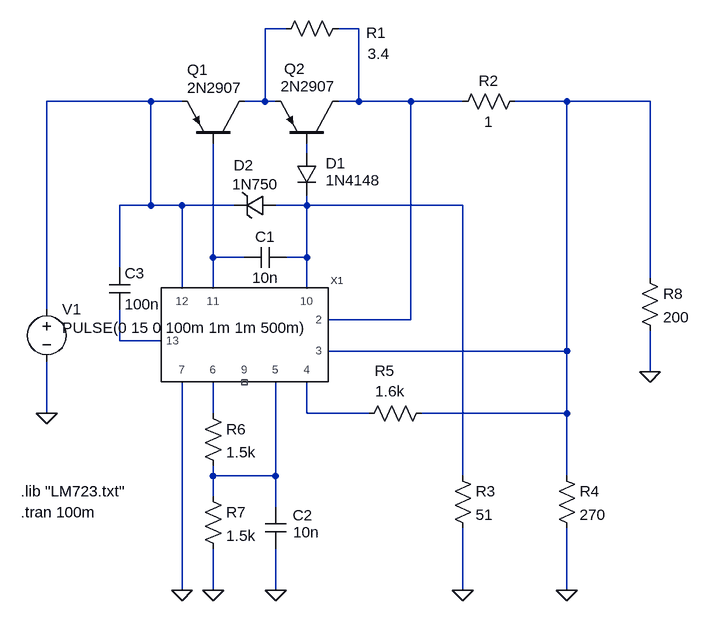
[diagram p0: schematic Draft4.asc]
Draft4.asc, the LTspice schematic file:
Version 4
SHEET 1 880 680
WIRE 176 -336 144 -336
WIRE 288 -336 256 -336
WIRE -32 -224 -192 -224
WIRE 16 -224 -32 -224
WIRE 144 -224 144 -336
WIRE 144 -224 112 -224
WIRE 160 -224 144 -224
WIRE 288 -224 288 -336
WIRE 288 -224 256 -224
WIRE 368 -224 288 -224
WIRE 448 -224 368 -224
WIRE 608 -224 528 -224
WIRE 736 -224 608 -224
WIRE 208 -144 208 -160
WIRE -32 -64 -32 -224
WIRE -32 -64 -80 -64
WIRE 16 -64 -32 -64
WIRE 96 -64 16 -64
WIRE 208 -64 208 -80
WIRE 208 -64 160 -64
WIRE 448 -64 208 -64
WIRE 64 16 64 -160
WIRE 112 16 64 16
WIRE 208 16 208 -64
WIRE 208 16 176 16
WIRE -80 32 -80 -64
WIRE 736 48 736 -224
WIRE 16 64 16 -64
WIRE 64 64 64 16
WIRE 208 64 208 16
WIRE -192 96 -192 -224
WIRE 368 112 368 -224
WIRE 368 112 240 112
WIRE -80 144 -80 96
WIRE -16 144 -80 144
WIRE 608 160 608 -224
WIRE 608 160 240 160
WIRE 736 192 736 128
WIRE -192 256 -192 176
WIRE 64 256 64 208
WIRE 208 256 208 208
WIRE 304 256 208 256
WIRE 608 256 608 160
WIRE 608 256 384 256
WIRE 64 352 64 336
WIRE 160 352 160 208
WIRE 160 352 64 352
WIRE 448 352 448 -64
WIRE 608 352 608 256
WIRE 64 384 64 352
WIRE 160 400 160 352
WIRE 16 528 16 208
WIRE 64 528 64 464
WIRE 160 528 160 464
WIRE 448 528 448 432
WIRE 608 528 608 432
FLAG -192 256 0
FLAG 736 192 0
FLAG 448 528 0
FLAG 608 528 0
FLAG 16 528 0
FLAG 64 528 0
FLAG 160 528 0
SYMBOL LM723 112 144 R0
SYMATTR InstName X1
SYMATTR Prefix X
SYMATTR SpiceModel LM723
SYMBOL voltage -192 80 R0
WINDOW 123 0 0 Left 2
WINDOW 39 0 0 Left 2
WINDOW 3 24 44 Left 2
SYMATTR InstName V1
SYMATTR Value PULSE(0 15 0 100m 1m 1m 500m)
SYMBOL pnp 112 -160 M270
WINDOW 0 113 88 VLeft 2
WINDOW 3 85 88 VLeft 2
SYMATTR InstName Q1
SYMATTR Value 2N2907
SYMBOL pnp 256 -160 M270
WINDOW 0 114 83 VLeft 2
WINDOW 3 87 88 VLeft 2
SYMATTR InstName Q2
SYMATTR Value 2N2907
SYMBOL diode 192 -144 R0
WINDOW 0 45 15 Left 2
WINDOW 3 45 41 Left 2
SYMATTR InstName D1
SYMATTR Value 1N4148
SYMBOL res 272 -352 R90
WINDOW 0 38 -43 VBottom 2
WINDOW 3 39 -47 VTop 2
SYMATTR InstName R1
SYMATTR Value 3.4
SYMBOL cap 176 0 R90
WINDOW 0 0 32 VBottom 2
WINDOW 3 32 32 VTop 2
SYMATTR InstName C1
SYMATTR Value 10n
SYMBOL res 544 -240 R90
WINDOW 0 0 56 VBottom 2
WINDOW 3 32 56 VTop 2
SYMATTR InstName R2
SYMATTR Value 1
SYMBOL zener 160 -80 R90
WINDOW 0 -30 49 VBottom 2
WINDOW 3 -32 31 VTop 2
SYMATTR InstName D2
SYMATTR Value 1N750
SYMATTR Description Diode
SYMATTR Type diode
SYMBOL res 432 336 R0
SYMATTR InstName R3
SYMATTR Value 51
SYMBOL res 592 336 R0
SYMATTR InstName R4
SYMATTR Value 270
SYMBOL res 400 240 R90
WINDOW 0 -34 72 VBottom 2
WINDOW 3 -34 64 VTop 2
SYMATTR InstName R5
SYMATTR Value 1.6k
SYMBOL res 48 240 R0
SYMATTR InstName R6
SYMATTR Value 1.5k
SYMBOL res 48 368 R0
SYMATTR InstName R7
SYMATTR Value 1.5k
SYMBOL cap 144 400 R0
WINDOW 0 42 13 Left 2
WINDOW 3 43 39 Left 2
SYMATTR InstName C2
SYMATTR Value 10n
SYMBOL cap -96 32 R0
SYMATTR InstName C3
SYMATTR Value 100n
SYMBOL res 720 32 R0
SYMATTR InstName R8
SYMATTR Value 200
TEXT -232 408 Left 2 !.tran 100m
TEXT -232 376 Left 2 !.lib "LM723.txt"

The netlist it stands for:
* Draft4.asc
XX1 N002 N004 N010 N011 N009 0 NC_01 N006 N007 N003 N008 LM723  ; pins 2 3 4 5 6 7 9 10 11 12 13
V1 N003 0 PULSE(0 15 0 100m 1m 1m 500m)
Q1 N001 N007 N003 0 2N2907
Q2 N002 N005 N001 0 2N2907
D1 N005 N006 1N4148
R1 N002 N001 3.4
C1 N006 N007 10n
R2 N004 N002 1
D2 N006 N003 1N750
R3 N006 0 51
R4 N004 0 270
R5 N004 N010 1.6k
R6 N009 N011 1.5k
R7 N011 0 1.5k
C2 N011 0 10n
C3 N003 N008 100n
R8 N004 0 200
.model D D
.lib standard.dio
.model NPN NPN
.model PNP PNP
.lib standard.bjt
.tran 100m
.lib "LM723.txt"
.backanno
.end